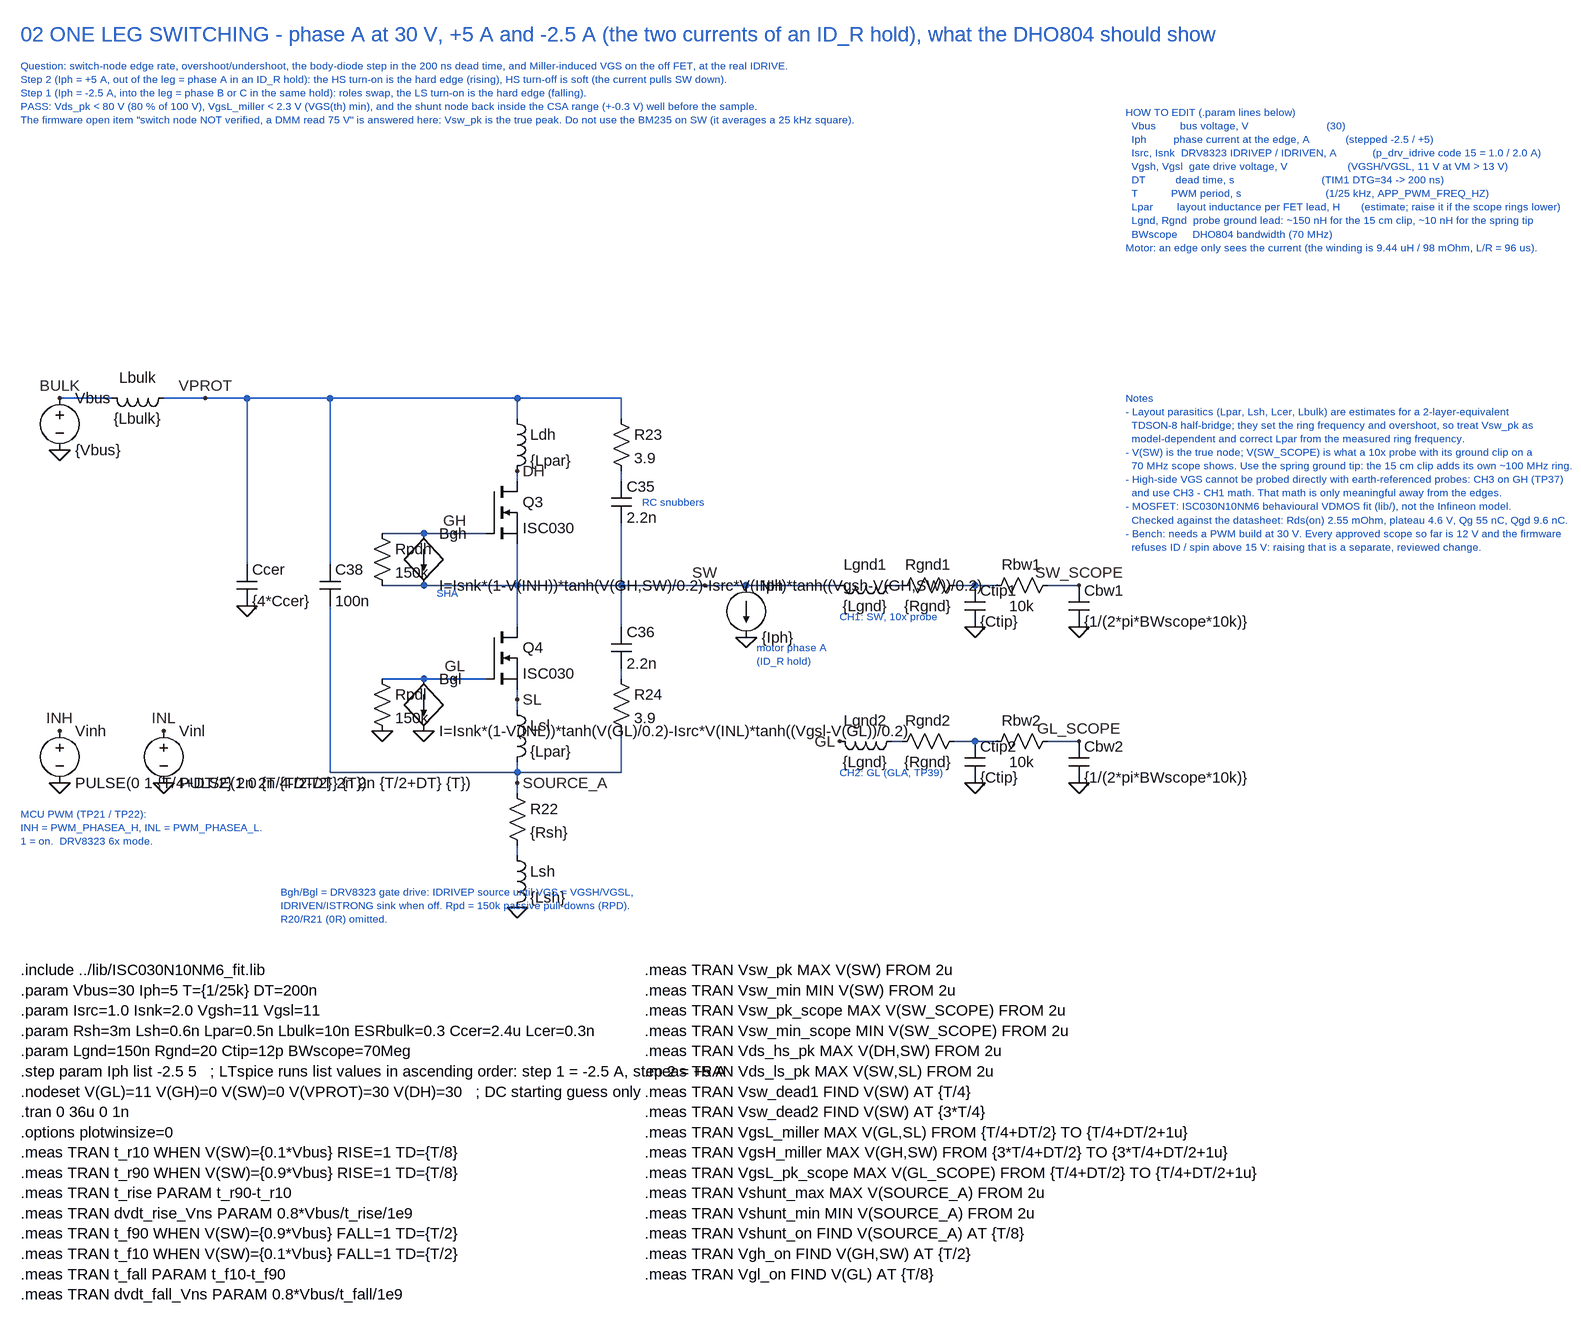
[diagram p0: schematic 02_leg_switching.asc]
02_leg_switching.asc, the LTspice schematic file:
Version 4
SHEET 1 2800 1800
WIRE -640 0 -560 0
WIRE -480 0 -416 0
WIRE -416 0 -352 0
WIRE -352 0 -224 0
WIRE -224 0 64 0
WIRE 64 0 192 0
WIRE -352 0 -352 256
WIRE -224 0 -224 256
WIRE -224 320 -224 576
WIRE -224 576 64 576
WIRE 64 0 64 32
WIRE 64 112 64 128
WIRE 64 224 64 288
WIRE 64 288 64 352
WIRE 64 448 64 464
WIRE 64 464 64 480
WIRE 64 560 64 576
WIRE 64 576 64 592
WIRE 64 592 64 608
WIRE 64 688 64 704
WIRE -80 208 -32 208
WIRE -32 208 16 208
WIRE -80 288 64 288
WIRE -144 208 -80 208
WIRE -144 288 -80 288
WIRE -80 432 -32 432
WIRE -32 432 16 432
WIRE -144 432 -80 432
WIRE 192 0 224 0
WIRE 224 0 224 32
WIRE 224 112 224 128
WIRE 224 192 224 288
WIRE 64 288 224 288
WIRE 224 288 224 352
WIRE 224 416 224 432
WIRE 224 512 224 576
WIRE 224 576 64 576
WIRE 224 288 352 288
WIRE 352 288 416 288
WIRE 416 288 560 288
WIRE 640 288 656 288
WIRE 736 288 768 288
WIRE 768 288 800 288
WIRE 880 288 928 288
WIRE 640 528 656 528
WIRE 736 528 768 528
WIRE 768 528 800 528
WIRE 880 528 928 528
FLAG -640 80 0
FLAG -640 0 BULK
FLAG -416 0 VPROT
FLAG -352 320 0
FLAG 64 112 DH
FLAG 64 464 SL
FLAG 64 592 SOURCE_A
FLAG 64 784 0
FLAG -32 208 GH
FLAG -32 432 GL
FLAG -80 512 0
FLAG -144 512 0
FLAG 352 288 SW
FLAG 416 368 0
FLAG 768 352 0
FLAG 928 352 0
FLAG 928 288 SW_SCOPE
FLAG 560 528 GL
FLAG 768 592 0
FLAG 928 592 0
FLAG 928 528 GL_SCOPE
FLAG -640 592 0
FLAG -640 512 INH
FLAG -480 592 0
FLAG -480 512 INL
SYMBOL voltage -640 -16 R0
SYMATTR InstName Vbus
SYMATTR Value {Vbus}
SYMBOL ind -464 -16 R90
WINDOW 0 0 56 VBottom 2
WINDOW 3 32 56 VTop 2
SYMATTR InstName Lbulk
SYMATTR Value {Lbulk}
SYMATTR SpiceLine Rser={ESRbulk/3}
SYMBOL cap -368 256 R0
SYMATTR InstName Ccer
SYMATTR Value {4*Ccer}
SYMATTR SpiceLine Rser=2m Lser={Lcer}
SYMBOL cap -240 256 R0
SYMATTR InstName C38
SYMATTR Value 100n
SYMATTR SpiceLine Rser=5m Lser=0.3n
SYMBOL ind 48 16 R0
SYMATTR InstName Ldh
SYMATTR Value {Lpar}
SYMBOL nmos 16 128 R0
SYMATTR InstName Q3
SYMATTR Value ISC030
SYMBOL nmos 16 352 R0
SYMATTR InstName Q4
SYMATTR Value ISC030
SYMBOL ind 48 464 R0
SYMATTR InstName Lsl
SYMATTR Value {Lpar}
SYMBOL res 48 592 R0
SYMATTR InstName R22
SYMATTR Value {Rsh}
SYMBOL ind 48 688 R0
SYMATTR InstName Lsh
SYMATTR Value {Lsh}
SYMBOL bi -80 208 R0
SYMATTR InstName Bgh
SYMATTR Value I=Isnk*(1-V(INH))*tanh(V(GH,SW)/0.2)-Isrc*V(INH)*tanh((Vgsh-V(GH,SW))/0.2)
SYMBOL res -160 192 R0
SYMATTR InstName Rpdh
SYMATTR Value 150k
SYMBOL bi -80 432 R0
SYMATTR InstName Bgl
SYMATTR Value I=Isnk*(1-V(INL))*tanh(V(GL)/0.2)-Isrc*V(INL)*tanh((Vgsl-V(GL))/0.2)
SYMBOL res -160 416 R0
SYMATTR InstName Rpdl
SYMATTR Value 150k
SYMBOL res 208 16 R0
SYMATTR InstName R23
SYMATTR Value 3.9
SYMBOL cap 208 128 R0
SYMATTR InstName C35
SYMATTR Value 2.2n
SYMBOL cap 208 352 R0
SYMATTR InstName C36
SYMATTR Value 2.2n
SYMBOL res 208 416 R0
SYMATTR InstName R24
SYMATTR Value 3.9
SYMBOL current 416 288 R0
SYMATTR InstName Iph
SYMATTR Value {Iph}
SYMBOL ind 656 272 R90
WINDOW 0 0 56 VBottom 2
WINDOW 3 32 56 VTop 2
SYMATTR InstName Lgnd1
SYMATTR Value {Lgnd}
SYMBOL res 752 272 R90
WINDOW 0 0 56 VBottom 2
WINDOW 3 32 56 VTop 2
SYMATTR InstName Rgnd1
SYMATTR Value {Rgnd}
SYMBOL cap 752 288 R0
SYMATTR InstName Ctip1
SYMATTR Value {Ctip}
SYMBOL res 896 272 R90
WINDOW 0 0 56 VBottom 2
WINDOW 3 32 56 VTop 2
SYMATTR InstName Rbw1
SYMATTR Value 10k
SYMBOL cap 912 288 R0
SYMATTR InstName Cbw1
SYMATTR Value {1/(2*pi*BWscope*10k)}
SYMBOL ind 656 512 R90
WINDOW 0 0 56 VBottom 2
WINDOW 3 32 56 VTop 2
SYMATTR InstName Lgnd2
SYMATTR Value {Lgnd}
SYMBOL res 752 512 R90
WINDOW 0 0 56 VBottom 2
WINDOW 3 32 56 VTop 2
SYMATTR InstName Rgnd2
SYMATTR Value {Rgnd}
SYMBOL cap 752 528 R0
SYMATTR InstName Ctip2
SYMATTR Value {Ctip}
SYMBOL res 896 512 R90
WINDOW 0 0 56 VBottom 2
WINDOW 3 32 56 VTop 2
SYMATTR InstName Rbw2
SYMATTR Value 10k
SYMBOL cap 912 528 R0
SYMATTR InstName Cbw2
SYMATTR Value {1/(2*pi*BWscope*10k)}
SYMBOL voltage -640 496 R0
SYMATTR InstName Vinh
SYMATTR Value PULSE(0 1 {T/4+DT/2} 2n 2n {T/2-DT} {T})
SYMBOL voltage -480 496 R0
SYMATTR InstName Vinl
SYMATTR Value PULSE(1 0 {T/4-DT/2} 2n 2n {T/2+DT} {T})
TEXT -700 640 Left 1 ;MCU PWM (TP21 / TP22):\nINH = PWM_PHASEA_H, INL = PWM_PHASEA_L.\n1 = on.  DRV8323 6x mode.
TEXT -60 300 Left 1 ;SHA
TEXT -300 760 Left 1 ;Bgh/Bgl = DRV8323 gate drive: IDRIVEP source until VGS = VGSH/VGSL,\nIDRIVEN/ISTRONG sink when off. Rpd = 150k passive pull-downs (RPD).\nR20/R21 (0R) omitted.
TEXT 432 384 Left 1 ;motor phase A\n(ID_R hold)
TEXT 560 336 Left 1 ;CH1: SW, 10x probe
TEXT 560 576 Left 1 ;CH2: GL (GLA, TP39)
TEXT 256 160 Left 1 ;RC snubbers
TEXT -700 -560 Left 3 ;02 ONE LEG SWITCHING - phase A at 30 V, +5 A and -2.5 A (the two currents of an ID_R hold), what the DHO804 should show
TEXT -700 -512 Left 1 ;Question: switch-node edge rate, overshoot/undershoot, the body-diode step in the 200 ns dead time, and Miller-induced VGS on the off FET, at the real IDRIVE.\nStep 2 (Iph = +5 A, out of the leg = phase A in an ID_R hold): the HS turn-on is the hard edge (rising), HS turn-off is soft (the current pulls SW down).\nStep 1 (Iph = -2.5 A, into the leg = phase B or C in the same hold): roles swap, the LS turn-on is the hard edge (falling).\nPASS: Vds_pk < 80 V (80 % of 100 V), VgsL_miller < 2.3 V (VGS(th) min), and the shunt node back inside the CSA range (+-0.3 V) well before the sample.\nThe firmware open item "switch node NOT verified, a DMM read 75 V" is answered here: Vsw_pk is the true peak. Do not use the BM235 on SW (it averages a 25 kHz square).
TEXT 1000 -440 Left 1 ;HOW TO EDIT (.param lines below)\n  Vbus        bus voltage, V                          (30)\n  Iph         phase current at the edge, A            (stepped -2.5 / +5)\n  Isrc, Isnk  DRV8323 IDRIVEP / IDRIVEN, A            (p_drv_idrive code 15 = 1.0 / 2.0 A)\n  Vgsh, Vgsl  gate drive voltage, V                    (VGSH/VGSL, 11 V at VM > 13 V)\n  DT          dead time, s                             (TIM1 DTG=34 -> 200 ns)\n  T           PWM period, s                            (1/25 kHz, APP_PWM_FREQ_HZ)\n  Lpar        layout inductance per FET lead, H       (estimate; raise it if the scope rings lower)\n  Lgnd, Rgnd  probe ground lead: ~150 nH for the 15 cm clip, ~10 nH for the spring tip\n  BWscope     DHO804 bandwidth (70 MHz)\nMotor: an edge only sees the current (the winding is 9.44 uH / 98 mOhm, L/R = 96 us).
TEXT -700 880 Left 2 !.include ../lib/ISC030N10NM6_fit.lib\n.param Vbus=30 Iph=5 T={1/25k} DT=200n\n.param Isrc=1.0 Isnk=2.0 Vgsh=11 Vgsl=11\n.param Rsh=3m Lsh=0.6n Lpar=0.5n Lbulk=10n ESRbulk=0.3 Ccer=2.4u Lcer=0.3n\n.param Lgnd=150n Rgnd=20 Ctip=12p BWscope=70Meg\n.step param Iph list -2.5 5   ; LTspice runs list values in ascending order: step 1 = -2.5 A, step 2 = +5 A\n.nodeset V(GL)=11 V(GH)=0 V(SW)=0 V(VPROT)=30 V(DH)=30   ; DC starting guess only\n.tran 0 36u 0 1n\n.options plotwinsize=0\n.meas TRAN t_r10 WHEN V(SW)={0.1*Vbus} RISE=1 TD={T/8}\n.meas TRAN t_r90 WHEN V(SW)={0.9*Vbus} RISE=1 TD={T/8}\n.meas TRAN t_rise PARAM t_r90-t_r10\n.meas TRAN dvdt_rise_Vns PARAM 0.8*Vbus/t_rise/1e9\n.meas TRAN t_f90 WHEN V(SW)={0.9*Vbus} FALL=1 TD={T/2}\n.meas TRAN t_f10 WHEN V(SW)={0.1*Vbus} FALL=1 TD={T/2}\n.meas TRAN t_fall PARAM t_f10-t_f90\n.meas TRAN dvdt_fall_Vns PARAM 0.8*Vbus/t_fall/1e9
TEXT 260 880 Left 2 !.meas TRAN Vsw_pk MAX V(SW) FROM 2u\n.meas TRAN Vsw_min MIN V(SW) FROM 2u\n.meas TRAN Vsw_pk_scope MAX V(SW_SCOPE) FROM 2u\n.meas TRAN Vsw_min_scope MIN V(SW_SCOPE) FROM 2u\n.meas TRAN Vds_hs_pk MAX V(DH,SW) FROM 2u\n.meas TRAN Vds_ls_pk MAX V(SW,SL) FROM 2u\n.meas TRAN Vsw_dead1 FIND V(SW) AT {T/4}\n.meas TRAN Vsw_dead2 FIND V(SW) AT {3*T/4}\n.meas TRAN VgsL_miller MAX V(GL,SL) FROM {T/4+DT/2} TO {T/4+DT/2+1u}\n.meas TRAN VgsH_miller MAX V(GH,SW) FROM {3*T/4+DT/2} TO {3*T/4+DT/2+1u}\n.meas TRAN VgsL_pk_scope MAX V(GL_SCOPE) FROM {T/4+DT/2} TO {T/4+DT/2+1u}\n.meas TRAN Vshunt_max MAX V(SOURCE_A) FROM 2u\n.meas TRAN Vshunt_min MIN V(SOURCE_A) FROM 2u\n.meas TRAN Vshunt_on FIND V(SOURCE_A) AT {T/8}\n.meas TRAN Vgh_on FIND V(GH,SW) AT {T/2}\n.meas TRAN Vgl_on FIND V(GL) AT {T/8}
TEXT 1000 0 Left 1 ;Notes\n- Layout parasitics (Lpar, Lsh, Lcer, Lbulk) are estimates for a 2-layer-equivalent\n  TDSON-8 half-bridge; they set the ring frequency and overshoot, so treat Vsw_pk as\n  model-dependent and correct Lpar from the measured ring frequency.\n- V(SW) is the true node; V(SW_SCOPE) is what a 10x probe with its ground clip on a\n  70 MHz scope shows. Use the spring ground tip: the 15 cm clip adds its own ~100 MHz ring.\n- High-side VGS cannot be probed directly with earth-referenced probes: CH3 on GH (TP37)\n  and use CH3 - CH1 math. That math is only meaningful away from the edges.\n- MOSFET: ISC030N10NM6 behavioural VDMOS fit (lib/), not the Infineon model.\n  Checked against the datasheet: Rds(on) 2.55 mOhm, plateau 4.6 V, Qg 55 nC, Qgd 9.6 nC.\n- Bench: needs a PWM build at 30 V. Every approved scope so far is 12 V and the firmware\n  refuses ID / spin above 15 V: raising that is a separate, reviewed change.

The netlist it stands for:
* 02_leg_switching.asc
Vbus BULK 0 {Vbus}
Lbulk VPROT BULK {Lbulk} Rser={ESRbulk/3}
Ccer VPROT 0 {4*Ccer} Rser=2m Lser={Lcer}
C38 VPROT SOURCE_A 100n Rser=5m Lser=0.3n
Ldh VPROT DH {Lpar}
M§Q3 DH GH SW SW ISC030
M§Q4 SW GL SL SL ISC030
Lsl SL SOURCE_A {Lpar}
R22 SOURCE_A N001 {Rsh}
Lsh N001 0 {Lsh}
Bgh GH SW I=Isnk*(1-V(INH))*tanh(V(GH,SW)/0.2)-Isrc*V(INH)*tanh((Vgsh-V(GH,SW))/0.2)
Rpdh GH SW 150k
Bgl GL 0 I=Isnk*(1-V(INL))*tanh(V(GL)/0.2)-Isrc*V(INL)*tanh((Vgsl-V(GL))/0.2)
Rpdl GL 0 150k
R23 VPROT N002 3.9
C35 N002 SW 2.2n
C36 SW N003 2.2n
R24 N003 SOURCE_A 3.9
Iph SW 0 {Iph}
Lgnd1 N004 SW {Lgnd}
Rgnd1 N005 N004 {Rgnd}
Ctip1 N005 0 {Ctip}
Rbw1 SW_SCOPE N005 10k
Cbw1 SW_SCOPE 0 {1/(2*pi*BWscope*10k)}
Lgnd2 N006 GL {Lgnd}
Rgnd2 N007 N006 {Rgnd}
Ctip2 N007 0 {Ctip}
Rbw2 GL_SCOPE N007 10k
Cbw2 GL_SCOPE 0 {1/(2*pi*BWscope*10k)}
Vinh INH 0 PULSE(0 1 {T/4+DT/2} 2n 2n {T/2-DT} {T})
Vinl INL 0 PULSE(1 0 {T/4-DT/2} 2n 2n {T/2+DT} {T})
.model NMOS NMOS
.model PMOS PMOS
.lib standard.mos
* MCU PWM (TP21 / TP22):
* INH = PWM_PHASEA_H, INL = PWM_PHASEA_L.
* 1 = on.  DRV8323 6x mode.
* SHA
* Bgh/Bgl = DRV8323 gate drive: IDRIVEP source until VGS = VGSH/VGSL,
* IDRIVEN/ISTRONG sink when off. Rpd = 150k passive pull-downs (RPD).
* R20/R21 (0R) omitted.
* motor phase A
* (ID_R hold)
* CH1: SW, 10x probe
* CH2: GL (GLA, TP39)
* RC snubbers
* 02 ONE LEG SWITCHING - phase A at 30 V, +5 A and -2.5 A (the two currents of an ID_R hold), what the DHO804 should show
* Question: switch-node edge rate, overshoot/undershoot, the body-diode step in the 200 ns dead time, and Miller-induced VGS on the off FET, at the real IDRIVE.
* Step 2 (Iph = +5 A, out of the leg = phase A in an ID_R hold): the HS turn-on is the hard edge (rising), HS turn-off is soft (the current pulls SW down).
* Step 1 (Iph = -2.5 A, into the leg = phase B or C in the same hold): roles swap, the LS turn-on is the hard edge (falling).
* PASS: Vds_pk < 80 V (80 % of 100 V), VgsL_miller < 2.3 V (VGS(th) min), and the shunt node back inside the CSA range (+-0.3 V) well before the sample.
* The firmware open item "switch node NOT verified, a DMM read 75 V" is answered here: Vsw_pk is the true peak. Do not use the BM235 on SW (it averages a 25 kHz square).
* HOW TO EDIT (.param lines below)
*   Vbus        bus voltage, V                          (30)
*   Iph         phase current at the edge, A            (stepped -2.5 / +5)
*   Isrc, Isnk  DRV8323 IDRIVEP / IDRIVEN, A            (p_drv_idrive code 15 = 1.0 / 2.0 A)
*   Vgsh, Vgsl  gate drive voltage, V                    (VGSH/VGSL, 11 V at VM > 13 V)
*   DT          dead time, s                             (TIM1 DTG=34 -> 200 ns)
*   T           PWM period, s                            (1/25 kHz, APP_PWM_FREQ_HZ)
*   Lpar        layout inductance per FET lead, H       (estimate; raise it if the scope rings lower)
*   Lgnd, Rgnd  probe ground lead: ~150 nH for the 15 cm clip, ~10 nH for the spring tip
*   BWscope     DHO804 bandwidth (70 MHz)
* Motor: an edge only sees the current (the winding is 9.44 uH / 98 mOhm, L/R = 96 us).
.include ../lib/ISC030N10NM6_fit.lib
.param Vbus=30 Iph=5 T={1/25k} DT=200n
.param Isrc=1.0 Isnk=2.0 Vgsh=11 Vgsl=11
.param Rsh=3m Lsh=0.6n Lpar=0.5n Lbulk=10n ESRbulk=0.3 Ccer=2.4u Lcer=0.3n
.param Lgnd=150n Rgnd=20 Ctip=12p BWscope=70Meg
.step param Iph list -2.5 5   ; LTspice runs list values in ascending order: step 1 = -2.5 A, step 2 = +5 A
.nodeset V(GL)=11 V(GH)=0 V(SW)=0 V(VPROT)=30 V(DH)=30   ; DC starting guess only
.tran 0 36u 0 1n
.options plotwinsize=0
.meas TRAN t_r10 WHEN V(SW)={0.1*Vbus} RISE=1 TD={T/8}
.meas TRAN t_r90 WHEN V(SW)={0.9*Vbus} RISE=1 TD={T/8}
.meas TRAN t_rise PARAM t_r90-t_r10
.meas TRAN dvdt_rise_Vns PARAM 0.8*Vbus/t_rise/1e9
.meas TRAN t_f90 WHEN V(SW)={0.9*Vbus} FALL=1 TD={T/2}
.meas TRAN t_f10 WHEN V(SW)={0.1*Vbus} FALL=1 TD={T/2}
.meas TRAN t_fall PARAM t_f10-t_f90
.meas TRAN dvdt_fall_Vns PARAM 0.8*Vbus/t_fall/1e9
.meas TRAN Vsw_pk MAX V(SW) FROM 2u
.meas TRAN Vsw_min MIN V(SW) FROM 2u
.meas TRAN Vsw_pk_scope MAX V(SW_SCOPE) FROM 2u
.meas TRAN Vsw_min_scope MIN V(SW_SCOPE) FROM 2u
.meas TRAN Vds_hs_pk MAX V(DH,SW) FROM 2u
.meas TRAN Vds_ls_pk MAX V(SW,SL) FROM 2u
.meas TRAN Vsw_dead1 FIND V(SW) AT {T/4}
.meas TRAN Vsw_dead2 FIND V(SW) AT {3*T/4}
.meas TRAN VgsL_miller MAX V(GL,SL) FROM {T/4+DT/2} TO {T/4+DT/2+1u}
.meas TRAN VgsH_miller MAX V(GH,SW) FROM {3*T/4+DT/2} TO {3*T/4+DT/2+1u}
.meas TRAN VgsL_pk_scope MAX V(GL_SCOPE) FROM {T/4+DT/2} TO {T/4+DT/2+1u}
.meas TRAN Vshunt_max MAX V(SOURCE_A) FROM 2u
.meas TRAN Vshunt_min MIN V(SOURCE_A) FROM 2u
.meas TRAN Vshunt_on FIND V(SOURCE_A) AT {T/8}
.meas TRAN Vgh_on FIND V(GH,SW) AT {T/2}
.meas TRAN Vgl_on FIND V(GL) AT {T/8}
* Notes
* - Layout parasitics (Lpar, Lsh, Lcer, Lbulk) are estimates for a 2-layer-equivalent
*   TDSON-8 half-bridge; they set the ring frequency and overshoot, so treat Vsw_pk as
*   model-dependent and correct Lpar from the measured ring frequency.
* - V(SW) is the true node; V(SW_SCOPE) is what a 10x probe with its ground clip on a
*   70 MHz scope shows. Use the spring ground tip: the 15 cm clip adds its own ~100 MHz ring.
* - High-side VGS cannot be probed directly with earth-referenced probes: CH3 on GH (TP37)
*   and use CH3 - CH1 math. That math is only meaningful away from the edges.
* - MOSFET: ISC030N10NM6 behavioural VDMOS fit (lib/), not the Infineon model.
*   Checked against the datasheet: Rds(on) 2.55 mOhm, plateau 4.6 V, Qg 55 nC, Qgd 9.6 nC.
* - Bench: needs a PWM build at 30 V. Every approved scope so far is 12 V and the firmware
*   refuses ID / spin above 15 V: raising that is a separate, reviewed change.
.backanno
.end